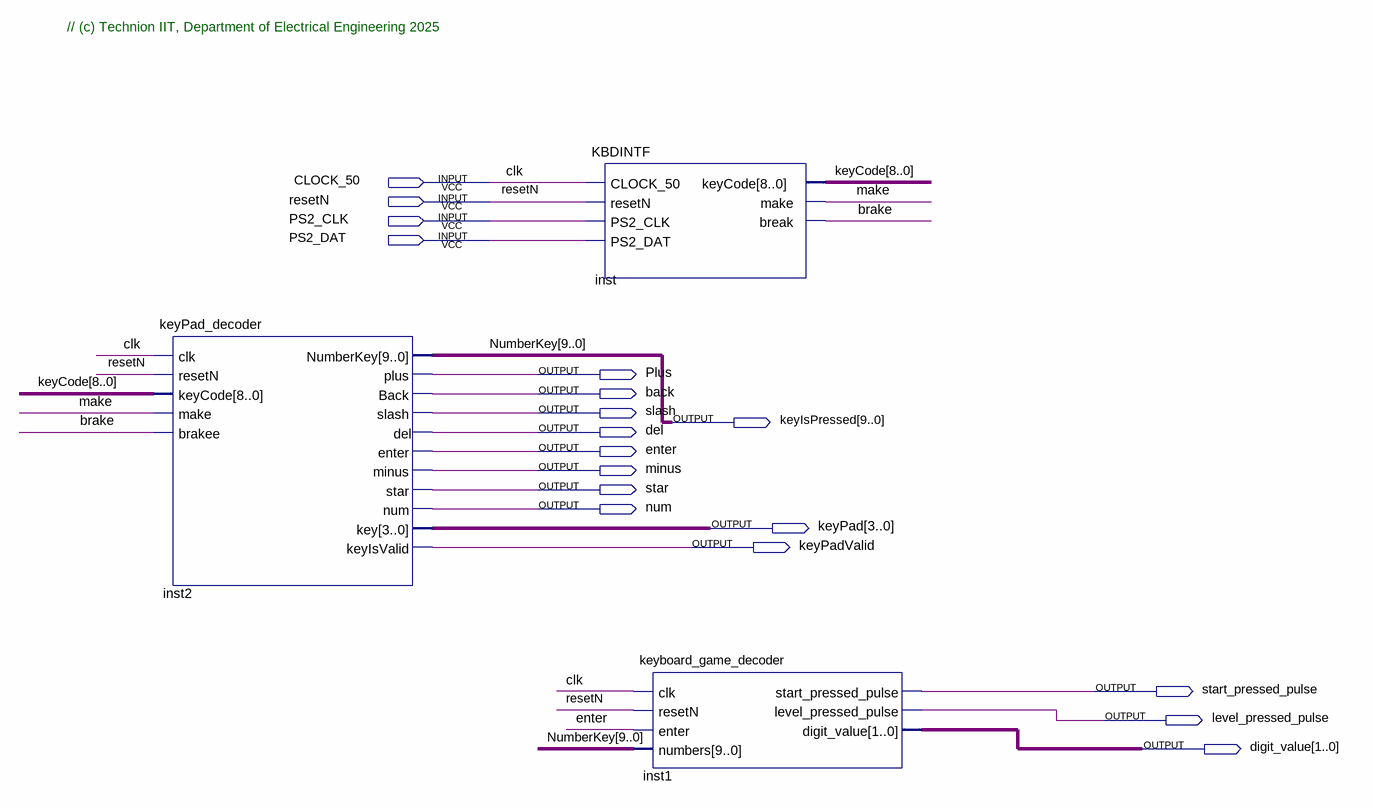
[diagram p0: schematic sheet]
// Quartus schematic TOP_KBD.bdf as structural Verilog: 3 symbols, 18 pins
module TOP_KBD (
  input  CLOCK_50,
  input  resetN,
  input  PS2_CLK,
  input  PS2_DAT,
  output Plus,
  output back,
  output slash,
  output [9:0] keyIsPressed,
  output del,
  output enter,
  output minus,
  output star,
  output num,
  output [3:0] keyPad,
  output keyPadValid,
  output start_pressed_pulse,
  output level_pressed_pulse,
  output [1:0] digit_value
);

  wire brake, make;
  wire [8:0] keyCode;

  keyPad_decoder inst2 (
    .clk(CLOCK_50), .resetN(resetN), .keyCode(keyCode), .make(make), .brakee(brake),
    .NumberKey(keyIsPressed), .plus(Plus), .Back(back), .slash(slash), .del(del), .enter(enter),
    .minus(minus), .star(star), .num(num), .key(keyPad), .keyIsValid(keyPadValid));
  KBDINTF inst (
    .CLOCK_50(CLOCK_50), .resetN(resetN), .PS2_CLK(PS2_CLK), .PS2_DAT(PS2_DAT), .keyCode(keyCode),
    .make(make), .\break (brake));
  keyboard_game_decoder inst1 (
    .clk(CLOCK_50), .resetN(resetN), .enter(enter), .numbers(keyIsPressed),
    .start_pressed_pulse(start_pressed_pulse), .level_pressed_pulse(level_pressed_pulse),
    .digit_value(digit_value));

  // Other names for the same wires on the sheet: clk = CLOCK_50; NumberKey[9:0] = keyIsPressed

  // Notes on the sheet:
  //   // (c) Technion IIT, Department of Electrical Engineering 2025
endmodule
